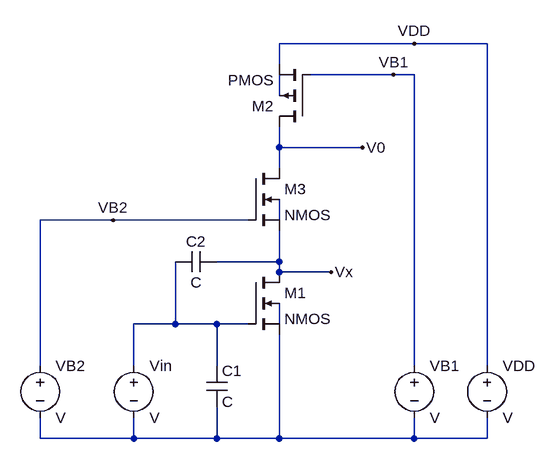
[diagram p0: schematic Exercise6.asc]
Exercise6.asc, the LTspice schematic file:
Version 4.1
SHEET 1 880 680
WIRE 624 -304 416 -304
WIRE 736 -304 624 -304
WIRE 416 -272 416 -304
WIRE 592 -256 464 -256
WIRE 624 -256 592 -256
WIRE 416 -224 416 -256
WIRE 416 -144 416 -176
WIRE 544 -144 416 -144
WIRE 416 -112 416 -144
WIRE 160 -32 48 -32
WIRE 368 -32 160 -32
WIRE 416 -32 416 -64
WIRE 416 32 416 -16
WIRE 416 32 320 32
WIRE 416 48 416 32
WIRE 496 48 416 48
WIRE 256 128 256 32
WIRE 256 128 192 128
WIRE 320 128 256 128
WIRE 368 128 320 128
WIRE 416 128 416 96
WIRE 48 192 48 -32
WIRE 192 192 192 128
WIRE 320 192 320 128
WIRE 624 192 624 -256
WIRE 736 192 736 -304
WIRE 48 304 48 272
WIRE 192 304 192 272
WIRE 192 304 48 304
WIRE 320 304 320 256
WIRE 320 304 192 304
WIRE 416 304 416 144
WIRE 416 304 320 304
WIRE 624 304 624 272
WIRE 624 304 416 304
WIRE 736 304 736 272
WIRE 736 304 624 304
FLAG 160 -32 VB2
FLAG 624 -304 VDD
FLAG 592 -256 VB1
FLAG 496 48 Vx
FLAG 544 -144 V0
SYMBOL voltage 48 176 R0
SYMATTR InstName VB2
SYMBOL voltage 192 176 R0
SYMATTR InstName Vin
SYMBOL voltage 624 176 R0
SYMATTR InstName VB1
SYMBOL voltage 736 176 R0
SYMATTR InstName VDD
SYMBOL cap 304 192 R0
SYMATTR InstName C1
SYMBOL cap 320 16 R90
WINDOW 0 0 32 VBottom 2
WINDOW 3 32 32 VTop 2
SYMATTR InstName C2
SYMBOL nmos4 368 48 R0
SYMATTR InstName M1
SYMBOL nmos4 368 -112 R0
SYMATTR InstName M3
SYMBOL pmos4 464 -176 R180
SYMATTR InstName M2

The netlist it stands for:
* Exercise6.asc
VB2 VB2 N005 V
Vin N003 N005 V
VB1 VB1 N005 V
VDD VDD N005 V
C1 N003 N005 C
C2 Vx N003 C
M1 Vx N003 N005 N004 NMOS
M3 V0 VB2 Vx N002 NMOS
M2 V0 VB1 VDD N001 PMOS
.model NMOS NMOS
.model PMOS PMOS
.lib standard.mos
.backanno
.end